# Altium schematic sheet Motor_Driver.SchDoc
size A3
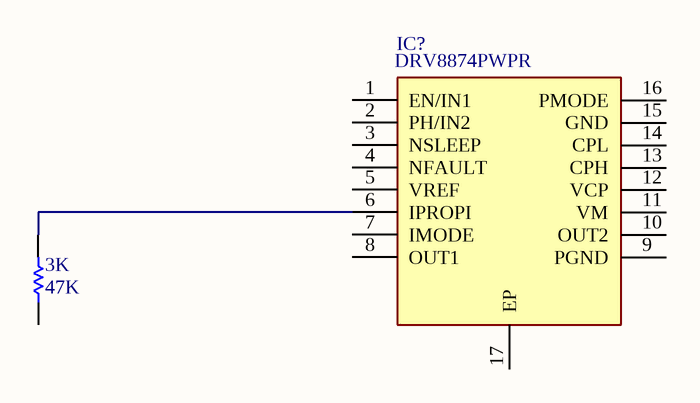
[diagram p0: Motor_Driver.SchDoc]

## Parts
3K  value 47K  [RES_0603]  (hidden comment: RES)
IC?  DRV8874PWPR  [SOP65P640X120-17N]

## Nets
Net3K_2: 3K.2 IC?.6(IPROPI)

Not connected (* = marked no-connect by the designer): 3K 1; IC? 1(EN/IN1) 2(PH/IN2) 3(NSLEEP) 4(NFAULT) 5(VREF) 7(IMODE) 8(OUT1) 9(PGND) 10(OUT2) 11(VM) 12(VCP) 13(CPH) 14(CPL) 15(GND) 16(PMODE) 17(EP)

## Library data of the parts
3K = R03000: RES 0603 47K Ohms 1% 1/10W-S 100PPM; Manufacturer: ROYALOHM; Manufacturer Part Number: 0603SAF4702T5E
IC? = DRV8874PWPR: Integrated Circuit; Manufacturer_Name: Texas Instruments; Datasheet Link: https://www.ti.com/lit/gpn/DRV8874; Height: 1.2mm; Manufacturer_Part_Number: DRV8874PWPR; Mouser Part Number: 595-DRV8874PWPR; Mouser Price/Stock: https://www.mouser.co.uk/ProductDetail/Texas-Instruments/DRV8874PWPR?qs=mAH9sUMRCtvh%2FSU15ywmDA%3D%3D; Arrow Part Number: DRV8874PWPR; Arrow Price/Stock: https://www.arrow.com/en/products/drv8874pwpr/texas-instruments.html?utm_currency=USD&region=nac